# Altium project Main-Board-v1.0.PrjPcb (part 1 of 5)
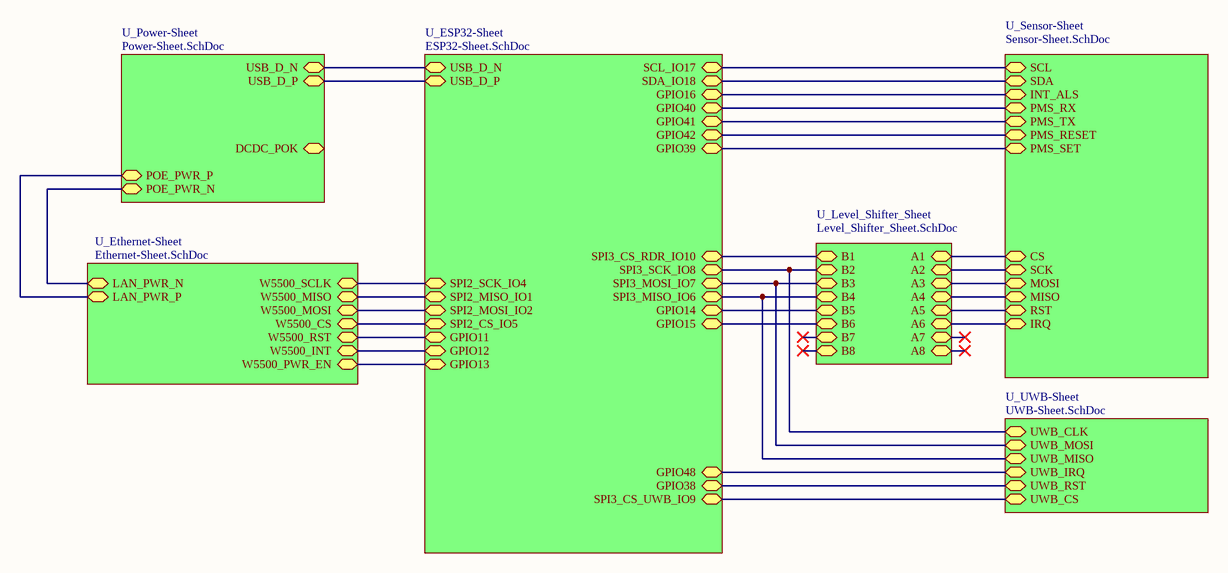
[diagram p0: Top-Sheet.SchDoc]
7 sheets, 176 parts. Net scope: hierarchical (ports join the sheet entries above them; power ports are global).
Board file: AmbientPro_Main_Board_V1.0.PcbDoc
Sheets:
  Top-Sheet.SchDoc
    U_Power-Sheet = Power-Sheet.SchDoc
    U_Sensor-Sheet = Sensor-Sheet.SchDoc
    U_Ethernet-Sheet = Ethernet-Sheet.SchDoc
    U_Level_Shifter_Sheet = Level_Shifter_Sheet.SchDoc
    U_ESP32-Sheet = ESP32-Sheet.SchDoc
    U_UWB-Sheet = UWB-Sheet.SchDoc

## Sheet Top-Sheet.SchDoc
size A4; SheetNumber: 1; SheetTotal: 7

### Sub-sheets
U_ESP32-Sheet = ESP32-Sheet.SchDoc: SPI2_MISO_IO1 (bidir), SPI2_MOSI_IO2 (bidir), SPI2_SCK_IO4 (bidir), SPI2_CS_IO5 (bidir), GPIO11 (bidir), GPIO12 (bidir), GPIO13 (bidir), GPIO16 (bidir), SCL_IO17 (bidir), SDA_IO18 (bidir), GPIO39 (bidir), GPIO40 (bidir), GPIO41 (bidir), GPIO42 (bidir), SPI3_CS_RDR_IO10 (bidir), SPI3_SCK_IO8 (bidir), SPI3_MOSI_IO7 (bidir), SPI3_MISO_IO6 (bidir), GPIO14 (bidir), GPIO15 (bidir), GPIO48 (bidir), GPIO38 (bidir), SPI3_CS_UWB_IO9 (bidir), USB_D_P (bidir), USB_D_N (bidir)
U_Ethernet-Sheet = Ethernet-Sheet.SchDoc: W5500_SCLK (bidir), W5500_MISO (bidir), W5500_MOSI (bidir), W5500_RST (bidir), W5500_INT (bidir), W5500_CS (bidir), W5500_PWR_EN (bidir), LAN_PWR_N (bidir), LAN_PWR_P (bidir)
U_Level_Shifter_Sheet = Level_Shifter_Sheet.SchDoc: A1 (bidir), A2 (bidir), A3 (bidir), A4 (bidir), A5 (bidir), A6 (bidir), A7 (bidir), A8 (bidir), B1 (bidir), B2 (bidir), B3 (bidir), B4 (bidir), B5 (bidir), B6 (bidir), B7 (bidir), B8 (bidir)
U_Power-Sheet = Power-Sheet.SchDoc: POE_PWR_P (bidir), POE_PWR_N (bidir), USB_D_P (bidir), USB_D_N (bidir), DCDC_POK (bidir)
U_Sensor-Sheet = Sensor-Sheet.SchDoc: CS (bidir), INT_ALS (bidir), IRQ (bidir), MISO (bidir), MOSI (bidir), PMS_RESET (bidir), PMS_RX (bidir), PMS_SET (bidir), PMS_TX (bidir), RST (bidir), SCK (bidir), SCL (bidir), SDA (bidir)
U_UWB-Sheet = UWB-Sheet.SchDoc: UWB_RST (bidir), UWB_CLK (bidir), UWB_MISO (bidir), UWB_MOSI (bidir), UWB_CS (bidir), UWB_IRQ (bidir)

### Nets
W5500_RST: sheet U_Ethernet-Sheet/W5500_RST, sheet U_ESP32-Sheet/GPIO11
A1: sheet U_Sensor-Sheet/CS, sheet U_Level_Shifter_Sheet/A1
A2: sheet U_Sensor-Sheet/SCK, sheet U_Level_Shifter_Sheet/A2
A3: sheet U_Sensor-Sheet/MOSI, sheet U_Level_Shifter_Sheet/A3
A4: sheet U_Sensor-Sheet/MISO, sheet U_Level_Shifter_Sheet/A4
A5: sheet U_Sensor-Sheet/RST, sheet U_Level_Shifter_Sheet/A5
A6: sheet U_Sensor-Sheet/IRQ, sheet U_Level_Shifter_Sheet/A6
B1: sheet U_Level_Shifter_Sheet/B1, sheet U_ESP32-Sheet/SPI3_CS_RDR_IO10
B2: sheet U_Level_Shifter_Sheet/B2, sheet U_ESP32-Sheet/SPI3_SCK_IO8, sheet U_UWB-Sheet/UWB_CLK
B3: sheet U_Level_Shifter_Sheet/B3, sheet U_ESP32-Sheet/SPI3_MOSI_IO7, sheet U_UWB-Sheet/UWB_MOSI
B4: sheet U_Level_Shifter_Sheet/B4, sheet U_ESP32-Sheet/SPI3_MISO_IO6, sheet U_UWB-Sheet/UWB_MISO
B5: sheet U_Level_Shifter_Sheet/B5, sheet U_ESP32-Sheet/GPIO14
B6: sheet U_Level_Shifter_Sheet/B6, sheet U_ESP32-Sheet/GPIO15
GPIO12: sheet U_Ethernet-Sheet/W5500_INT, sheet U_ESP32-Sheet/GPIO12
GPIO13: sheet U_Ethernet-Sheet/W5500_PWR_EN, sheet U_ESP32-Sheet/GPIO13
GPIO16: sheet U_Sensor-Sheet/INT_ALS, sheet U_ESP32-Sheet/GPIO16
GPIO38: sheet U_ESP32-Sheet/GPIO38, sheet U_UWB-Sheet/UWB_RST
GPIO39: sheet U_Sensor-Sheet/PMS_SET, sheet U_ESP32-Sheet/GPIO39
GPIO40: sheet U_Sensor-Sheet/PMS_RX, sheet U_ESP32-Sheet/GPIO40
GPIO41: sheet U_Sensor-Sheet/PMS_TX, sheet U_ESP32-Sheet/GPIO41
GPIO42: sheet U_Sensor-Sheet/PMS_RESET, sheet U_ESP32-Sheet/GPIO42
GPIO48: sheet U_ESP32-Sheet/GPIO48, sheet U_UWB-Sheet/UWB_IRQ
LAN_PWR_N: sheet U_Power-Sheet/POE_PWR_N, sheet U_Ethernet-Sheet/LAN_PWR_N
LAN_PWR_P: sheet U_Power-Sheet/POE_PWR_P, sheet U_Ethernet-Sheet/LAN_PWR_P
SCL: sheet U_Sensor-Sheet/SCL, sheet U_ESP32-Sheet/SCL_IO17
SDA: sheet U_Sensor-Sheet/SDA, sheet U_ESP32-Sheet/SDA_IO18
SPI2_CS_IO5: sheet U_Ethernet-Sheet/W5500_CS, sheet U_ESP32-Sheet/SPI2_CS_IO5
SPI2_MISO_IO1: sheet U_Ethernet-Sheet/W5500_MISO, sheet U_ESP32-Sheet/SPI2_MISO_IO1
SPI2_MOSI_IO2: sheet U_Ethernet-Sheet/W5500_MOSI, sheet U_ESP32-Sheet/SPI2_MOSI_IO2
SPI2_SCK_IO4: sheet U_Ethernet-Sheet/W5500_SCLK, sheet U_ESP32-Sheet/SPI2_SCK_IO4
SPI3_CS_UWB_IO9: sheet U_ESP32-Sheet/SPI3_CS_UWB_IO9, sheet U_UWB-Sheet/UWB_CS
USB_D_N: sheet U_Power-Sheet/USB_D_N, sheet U_ESP32-Sheet/USB_D_N
USB_D_P: sheet U_Power-Sheet/USB_D_P, sheet U_ESP32-Sheet/USB_D_P

### Notes on the sheet
- File:
- Title:
- Date:
- Page
- Num:
- Total:
- Drawn By: Huzaifa Ali

## Sheet Power-Sheet.SchDoc
size 420 x 297 mm; SheetNumber: 2; SheetTotal: 7
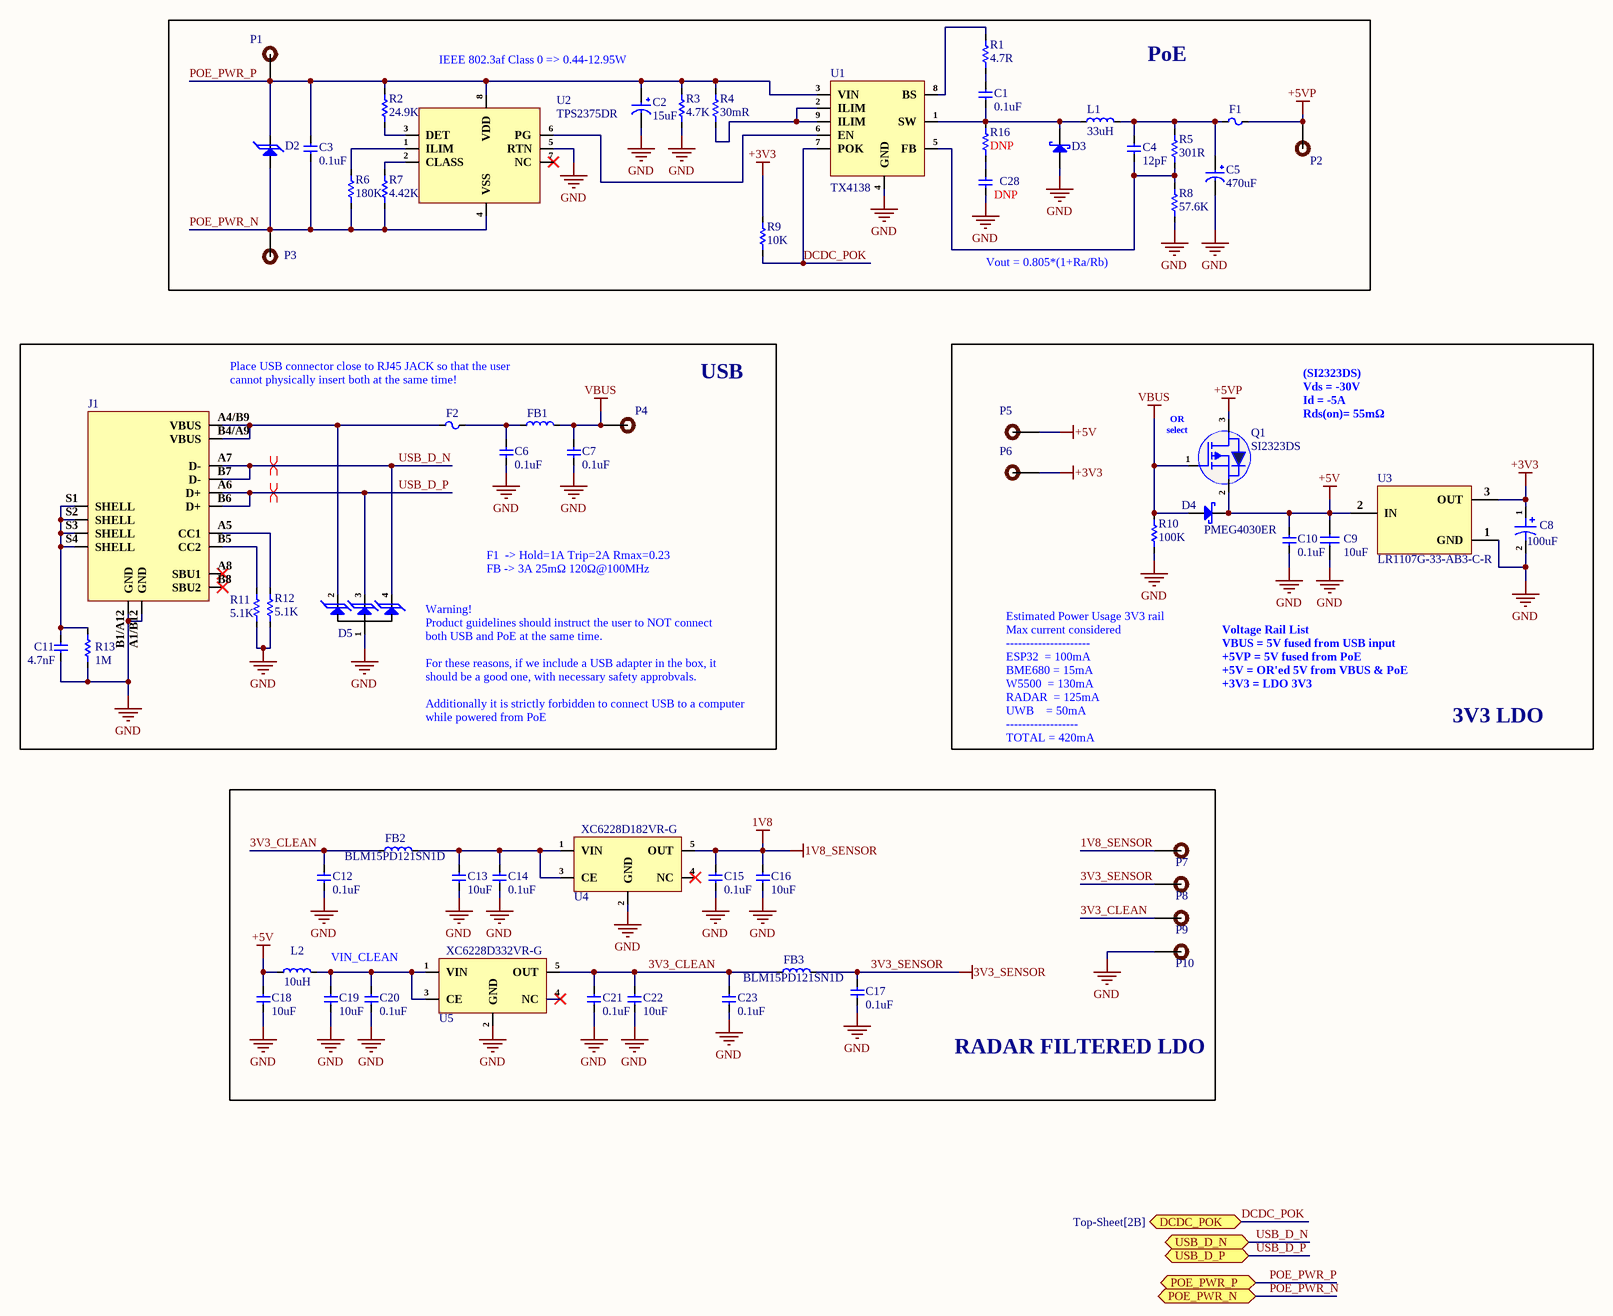
[diagram p1: Power-Sheet.SchDoc]

### Parts
C1  0.1uF  [Cap-0603]
C2  15uF  [UD2C150M1010]
C3  0.1uF  [Cap-0603]
C4  12pF  [Cap-0603]
C5  470uF  [VZH471M1CTR-0810]
C6  0.1uF  [Cap-0402]
C7  0.1uF  [Cap-0402]
C8  100uF  [UCD1A101MCL1GS]
C9  10uF  [Cap-0603]
C10  0.1uF  [Cap-0402]
C11  4.7nF  [Cap-1206]
C12  0.1uF  [Cap-0402]
C13  10uF  [Cap-0402]
C14  0.1uF  [Cap-0402]
C15  0.1uF  [Cap-0402]
C16  10uF  [Cap-0402]
C17  0.1uF  [Cap-0402]
C18  10uF  [Cap-0402]
C19  10uF  [Cap-0402]
C20  0.1uF  [Cap-0402]
C21  0.1uF  [Cap-0402]
C22  10uF  [Cap-0402]
C23  0.1uF  [Cap-0402]
C28  DNP  [Cap-0603]
D2  SMAJ58A  [SMA]  (value not drawn)
D3  SS510B  [SMB_]  (value not drawn)
D4  PMEG4030ER  [SOD-123FL]
D5  SP0503BAHTG  [SOT-143-4_]  (value not drawn)
F1  BSMD0805L-200  [Fuse-0805]  (value not drawn)
F2  BSMD0805L-200  [Fuse-0805]  (value not drawn)
FB1  BLM18SG121TN1D  [IND-0603 (1608 Metric)]  (value not drawn)
FB2  BLM15PD121SN1D  [IND-0402]
FB3  BLM15PD121SN1D  [IND-0402]
J1  TYPE-C-31-M-12  [TYPE-C-31-M-12_]  (value not drawn)
L1  33uH  [CYH127-33UH]
L2  10uH  [IND-1008 (2520 Metric)]
P1  TEST POINT  [Test-point]  (value not drawn)
P2  TEST POINT  [Test-point]  (value not drawn)
P3  TEST POINT  [Test-point]  (value not drawn)
P4  TEST POINT  [Test-point]  (value not drawn)
P5  TEST POINT  [Test-point]  (value not drawn)
P6  TEST POINT  [Test-point]  (value not drawn)
P7  TEST POINT  [Test-point]  (value not drawn)
P8  TEST POINT  [Test-point]  (value not drawn)
P9  TEST POINT  [Test-point]  (value not drawn)
P10  TEST POINT  [Test-point]  (value not drawn)
Q1  SI2323DS  [SOT-23]
R1  4.7R  [Res-0603]
R2  24.9K  [Res-0402]
R3  4.7K  [Res-0603]
R4  30mR  [RES-0805]
R5  301R  [Res-0603]
R6  180K  [Res-0603]
R7  4.42K  [Res-0603]
R8  57.6K  [Res-0603]
R9  10K  [Res-0402]
R10  100K  [Res-0603]
R11  5.1K  [Res-0402]
R12  5.1K  [Res-0402]
R13  1M  [Res-0603]
R16  DNP  [Res-0402]
U1  TX4138  [8-SOIC-EP]
U2  TPS2375DR  [SOIC-8]
U3  LR1107G-33-AB3-C-R  [SOT-89-3]
U4  XC6228D182VR-G  [SOT-25-5]
U5  XC6228D332VR-G  [SOT-25-5]

### Blocks framed on the sheet
PoE: C1-C5 C28 D2 D3 F1 L1 P1-P3 R1-R9 R16 U1 U2
USB: C6 C7 C11 D5 F2 FB1 J1 P4 R11-R13
3V3 LDO: C8-C10 D4 P5 P6 Q1 R10 U3
RADAR FILTERED LDO: C12-C23 FB2 FB3 L2 P7-P10 U4 U5

### Ports
DCDC_POK (bidir, see Top-Sheet[2B]), POE_PWR_N (bidir, see Top-Sheet[1B]), POE_PWR_P (bidir, see Top-Sheet[1B]), USB_D_N (bidir, see Top-Sheet[2A], ESP32-Sheet[2D]), USB_D_P (bidir, see Top-Sheet[2A], ESP32-Sheet[2D])

### Nets
1V8_SENSOR: C15.2 C16.2 P7.1 U4.5(OUT)  [also labelled 1V8]
3V3_SENSOR: C17.2 FB3.2 P8.1
+3V3: C8.1 P6.1 R9.2 U3.3(OUT)
+5V: C9.1 C10.2 C18.2 D4.1(K) L2.1 P5.1 Q1.2(S) U3.2(IN)
+5VP: F1.2 P2.1 Q1.3(D)
GND: C2.2 C5.2 C6.1 C7.1 C8.2 C9.2 C10.1 C11.2 C12.1 C13.1 C14.1 C15.1 C16.1 C17.1 C18.1 C19.1 C20.1 C21.1 C22.1 C23.1 C28.1 D3.1(A) D5.1(A) J1.A1/B12(GND) J1.B1/A12(GND) P10.1 R3.1 R8.1 R10.1 R11.1 R12.1 R13.2 U1.4(GND) U2.5(RTN) U3.1(GND) U4.2(GND) U5.2(GND)
VBUS: C7.2 D4.2(A) FB1.2 P4.1 Q1.1(G) R10.2
3V3_CLEAN: C12.2 C21.2 C22.2 C23.2 FB2.1 FB3.1 P9.1 U5.5(OUT)
DCDC_POK: R9.1 U1.7(POK) ; port DCDC_POK
POE_PWR_N: C3.1 D2.2(K) P3.1 R6.1 R7.1 U2.4(VSS) ; port POE_PWR_N  [project net LAN_PWR_N]
POE_PWR_P: C2.1 C3.2 D2.1(K) P1.1 R2.2 R3.2 R4.2 U1.3(VIN) U2.8(VDD) ; port POE_PWR_P  [project net LAN_PWR_P]
USB_D_N: D5.4(K) J1.A7(D-) J1.B7(D-) ; port USB_D_N
USB_D_P: D5.3(K) J1.A6(D+) J1.B6(D+) ; port USB_D_P
NetC1_1: C1.1 D3.2(K) L1.1 R16.2 U1.1(SW)
NetC1_2: C1.2 R1.1
NetC4_1: C4.1 R5.1 R8.2 U1.5(FB)
NetC4_2: C4.2 C5.1 F1.1 L1.2 R5.2
NetC6_2: C6.2 F2.2 FB1.1
NetC11_1: C11.1 J1.S1(SHELL) J1.S2(SHELL) J1.S3(SHELL) J1.S4(SHELL) R13.1
NetC13_2: C13.2 C14.2 FB2.2 U4.1(VIN) U4.3(CE)
NetC19_2: C19.2 C20.2 L2.2 U5.1(VIN) U5.3(CE)
NetC28_2: C28.2 R16.1
NetD5_2: D5.2(K) F2.1 J1.A4/B9(VBUS) J1.B4/A9(VBUS)
NetJ1_A5: J1.A5(CC1) R12.2
NetJ1_B5: J1.B5(CC2) R11.2
NetR1_2: R1.2 U1.8(BS)
NetR2_1: R2.1 U2.3(DET)
NetR4_1: R4.1 U1.2(ILIM) U1.9(ILIM)
NetR6_2: R6.2 U2.1(ILIM)
NetR7_2: R7.2 U2.2(CLASS)
NetU1_6: U1.6(EN) U2.6(PG)

Not connected (* = marked no-connect by the designer): J1 A8(SBU1)* B8(SBU2)*; U2 7(NC)*; U4 4(NC)*; U5 4(NC)*

### Layout directives
differential pair; net class USB; differential pair class USB_Lines; rule Impedance Constraint [Min = 87.00    Max = 92.00    ]; rule Matched Net Lengths [Tolerance = 0.508mm]: USB_D_N, USB_D_P

### Notes on the sheet
- IEEE 802.3af Class 0 => 0.44-12.95W
- Vout = 0.805*(1+Ra/Rb)
- Place USB connector close to RJ45 JACK so that the user
  cannot physically insert both at the same time!
- (near Q1) OR
  select
- (SI2323DS)
  Vds = -30V
  Id = -5A
  Rds(on)= 55mΩ
- F1  -> Hold=1A Trip=2A Rmax=0.23
  FB -> 3A 25mΩ 120Ω@100MHz
- Voltage Rail List
  VBUS = 5V fused from USB input
  +5VP = 5V fused from PoE
  +5V = OR'ed 5V from VBUS & PoE
  +3V3 = LDO 3V3
- (near D5) Warning!
  Product guidelines should instruct the user to NOT connect
  both USB and PoE at the same time.
  For these reasons, if we include a USB adapter in the box, it
  should be a good one, with necessary safety approbvals.
  Additionally it is strictly forbidden to connect USB to a computer
  while powered from PoE
- Estimated Power Usage 3V3 rail
  Max current considered
  ---------------------
  ESP32  = 100mA
  BME680 = 15mA
  W5500  = 130mA
  RADAR  = 125mA
  UWB    = 50mA
  ------------------
  TOTAL = 420mA
- VIN_CLEAN
- File:
- Title:
- Date:
- Page
- Num:
- Total:
- Drawn By: Huzaifa Ali